# Altium project 1.PrjPcb
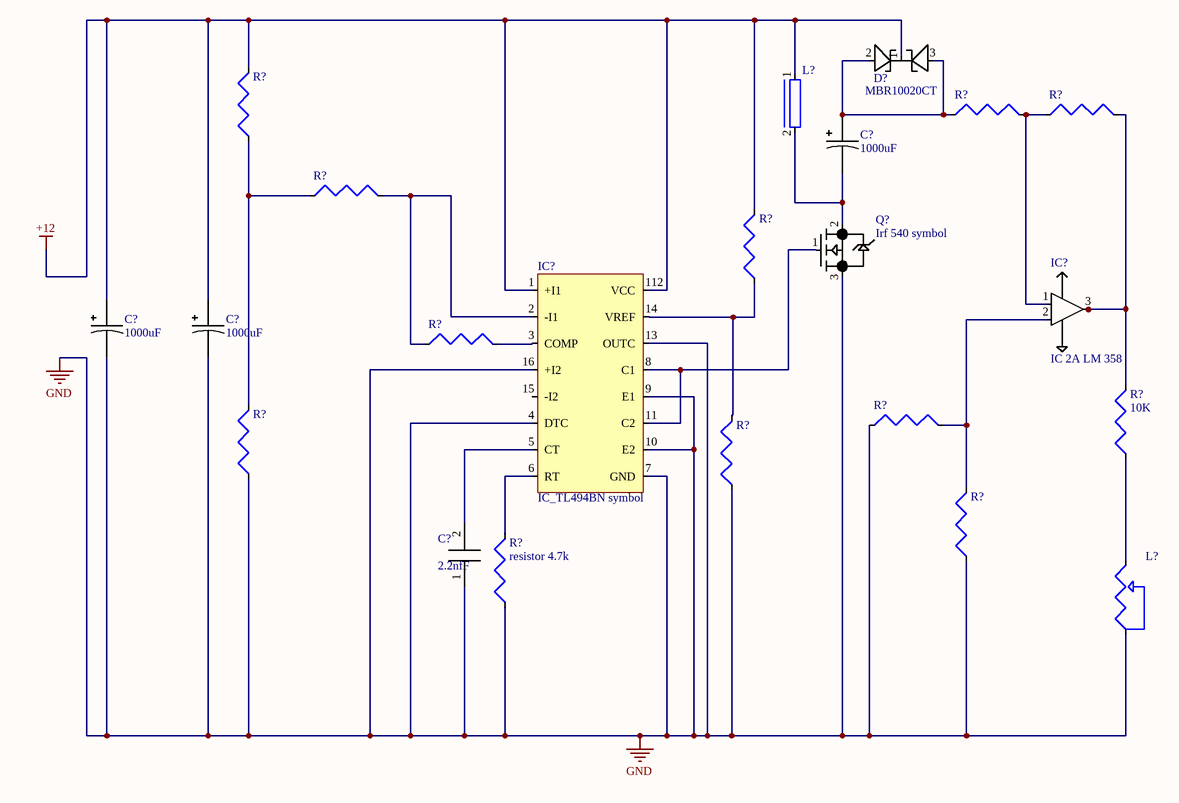
[diagram p0: Sheet1.SchDoc]
2 sheets, 28 parts. Net scope: global (net labels, ports and power ports of the same name join across sheets).
Board file: PCB1.PcbDoc
Sheets:
  Sheet1.SchDoc
  Sheet2.SchDoc

## Sheet Sheet1.SchDoc
size B; SheetNumber: 1; SheetTotal: 2

### Parts
(Parts that share a designator on the sheet are numbered #1, #2 ... from top to bottom, then left to right.)
C?#1  1000uF  [capacitor]
C?#2  1000uF  [capacitor]
C?#3  1000uF  [capacitor]
C?#4  value 2.2nfF  [capacitor]  (hidden comment: capacitor symbol)
D?  MBR10020CT  [IRF 540 through hole]
IC?#1  IC 2A LM 358  [IC-2A-LM358]
IC?#2  IC_TL494BN symbol  [TL494BN]
L?#1  L1  [capacitor]  (value not drawn)
L?#2  potentiomater  [Resistor]  (value not drawn)
Q?  Irf 540 symbol  [IRF 540 through hole]
R?#1  Resistor 1206  [Resistor]  (value not drawn)
R?#2  Resistor 1206  [Resistor]  (value not drawn)
R?#3  Resistor 1206  [Resistor]  (value not drawn)
R?#4  Resistor 1206  [Resistor]  (value not drawn)
R?#5  Resistor 1206  [Resistor]  (value not drawn)
R?#6  Resistor 1206  [Resistor]  (value not drawn)
R?#7  Resistor 1206  [Resistor]  (value not drawn)
R?#8  10K  [Resistor]
R?#9  Resistor 1206  [Resistor]  (value not drawn)
R?#10  Resistor 1206  [Resistor]  (value not drawn)
R?#11  Resistor 1206  [Resistor]  (value not drawn)
R?#12  resistor 4.7k  [Resistor]

### Nets
+12: C?#2.1 C?#3.1 D?.1 IC?#2.1(+I1) IC?#2.112(VCC) L?#1.1 R?#3.2 R?#5.2
GND: C?#2.2 C?#3.2 C?#4.1 IC?#2.4(DTC) IC?#2.7(GND) IC?#2.9(E1) IC?#2.10(E2) IC?#2.13(OUTC) IC?#2.16(+I2) L?#2.1 Q?.3 R?#7.1 R?#9.1 R?#10.1 R?#11.1 R?#12.1(cathode)
NetC?#1_1: C?#1.1 D?.2 D?.3 R?#1.1
NetC?#1_2: C?#1.2 L?#1.2 Q?.2
NetC?#4_2: C?#4.2 IC?#2.5(CT)
NetIC?#1_1: IC?#1.1 R?#1.2 R?#2.1
NetIC?#1_2: IC?#1.2 R?#7.2 R?#11.2
NetIC?#1_3: IC?#1.3 R?#2.2 R?#8.2
NetIC?#2_2: IC?#2.2(-I1) R?#4.2 R?#6.1
NetIC?#2_3: IC?#2.3(COMP) R?#6.2
NetIC?#2_6: IC?#2.6(RT) R?#12.2(anode)
NetIC?#2_8: IC?#2.8(C1) IC?#2.11(C2) Q?.1
NetIC?#2_14: IC?#2.14(VREF) R?#5.1 R?#10.2
NetL?#2_2: L?#2.2 R?#8.1
NetR?#3_1: R?#3.1 R?#4.1 R?#9.2

Not connected (* = marked no-connect by the designer): IC?#2 15(-I2)

### Library data of the parts
L?#1 = inductor
R?#8 = Resistor 1206

## Sheet Sheet2.SchDoc
size A; SheetNumber: 2; SheetTotal: 2
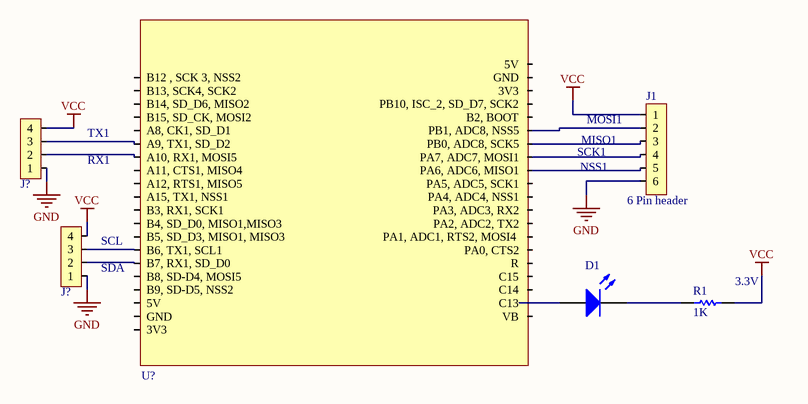
[diagram p1: Sheet2.SchDoc]

### Parts
(Parts that share a designator on the sheet are numbered #1, #2 ... from top to bottom, then left to right.)
D1  Light-Emitting Diode  (value not drawn)
J1  6 Pin header  [6 pin header STM32]
J?#1  hg  [Headeer stm32]  (value not drawn)
J?#2  hg  [Headeer stm32]  (value not drawn)
R1  value 1K  (hidden comment: Resistor)
U?  STM 32 Black pill  [STM 32 Black pill]  (value not drawn)

### Nets
GND: J1.6 J?#1.1 J?#2.1
VCC: J1.1 J?#1.4 J?#2.4 R1.2
NetD1_1: D1.1(A) U?.23(C13)
NetD1_2: D1.2(K) R1.1
NetJ1_2: J1.2 U?.37(PB1,_ADC8,_NSS5)
NetJ1_3: J1.3 U?.36(PB0,_ADC8,_SCK5)
NetJ1_4: J1.4 U?.35(PA7,_ADC7,_MOSI1)
NetJ1_5: J1.5 U?.34(PA6,_ADC6,_MISO1)
NetJ?#1_2: J?#1.2 U?.7(A10,_RX1,_MOSI5)
NetJ?#1_3: J?#1.3 U?.6(A9,_TX1,_SD_D2)
NetJ?#2_2: J?#2.2 U?.17(B7,_RX1,_SD_D0)
NetJ?#2_3: J?#2.3 U?.16(B6,_TX1,_SCL1)

Not connected (* = marked no-connect by the designer): U? 1(B12_,_SCK_3,_NSS2_______________________________________________________________________________) 2(B13,_SCK4,_SCK2) 3(B14,_SD_D6,_MISO2) 4(B15,_SD_CK,_MOSI2) 5(A8,_CK1,_SD_D1) 8(A11,_CTS1,_MISO4) 9(A12,_RTS1,_MISO5) 11(A15,_TX1,_NSS1) 12(B3,_RX1,_SCK1) 13(B4,_SD_D0,_MISO1,MISO3) 15(B5,_SD_D3,_MISO1,_MISO3) 18(B8,_SD-D4,_MOSI5) 19(5V) 20(GND) 21(3V3) 22(VB) 24(C14) 25(C15) 26(R) 27(PA0,_CTS2) 28(PA1,_ADC1,_RTS2,_MOSI4_) 29(PA2,_ADC2,_TX2) 30(PA3,_ADC3,_RX2) 32(PA4,_ADC4,_NSS1) 33(PA5,_ADC5,_SCK1) 38(B2,_BOOT) 39(PB10,_ISC_2,_SD_D7,_SCK2) 40(3V3) 41(GND) 42(5V) 50(B9,_SD-D5,_NSS2)

### Notes on the sheet
- (near J1) MOSI1
- TX1
- RX1
- SCK1
- NSS1
- MISO1
- SCL
- SDA
- (near R1) 3.3V

### Library data of the parts
D1 = LED: AF: 1; BV: 0; BV_MAX: 1e99; EG: 1.11; FC: 0.5; IBV: 0.001; IS: 1e-14; MJSW: 0.33; NTUN: 30; TNOM: 27; XTI: 3; SimulationGenericComponent: True; CJO: 0; CJP: 0; CTA: 0; CTP: 0; FCS: 0.5; FV_MAX: 1e99; IKF: 0; IKR: 0; ISR: 1e-14; JSW: 0; JTUN: 0; JTUNSW: 0; KEG: 1; KF: 0; LEVEL: 1; N: 1; NBV: 1; NR: 1; NS: 1; PHP: 1; RS: 0; TCV: 0; TLEV: 0; TLEVC: 0; TM1: 0; TM2: 0; TPB: 0; TPHP: 0; TRS: 0; TRS2: 0; TT: 0; TTT1: 0; TTT2: 0; VJ: 1; XTITUN: 3
J?#1 J?#2 = 4 Pin header
R1 = Resistor: TC1: 0; SimulationGenericComponent: True; TC2: 0

## Nets that join several sheets
GND: Sheet1 (16 pins), Sheet2 (J1.6 J?#1.1 J?#2.1)